# Altium schematic sheet 60_ETHERNET.SchDoc
size 297 x 209 mm
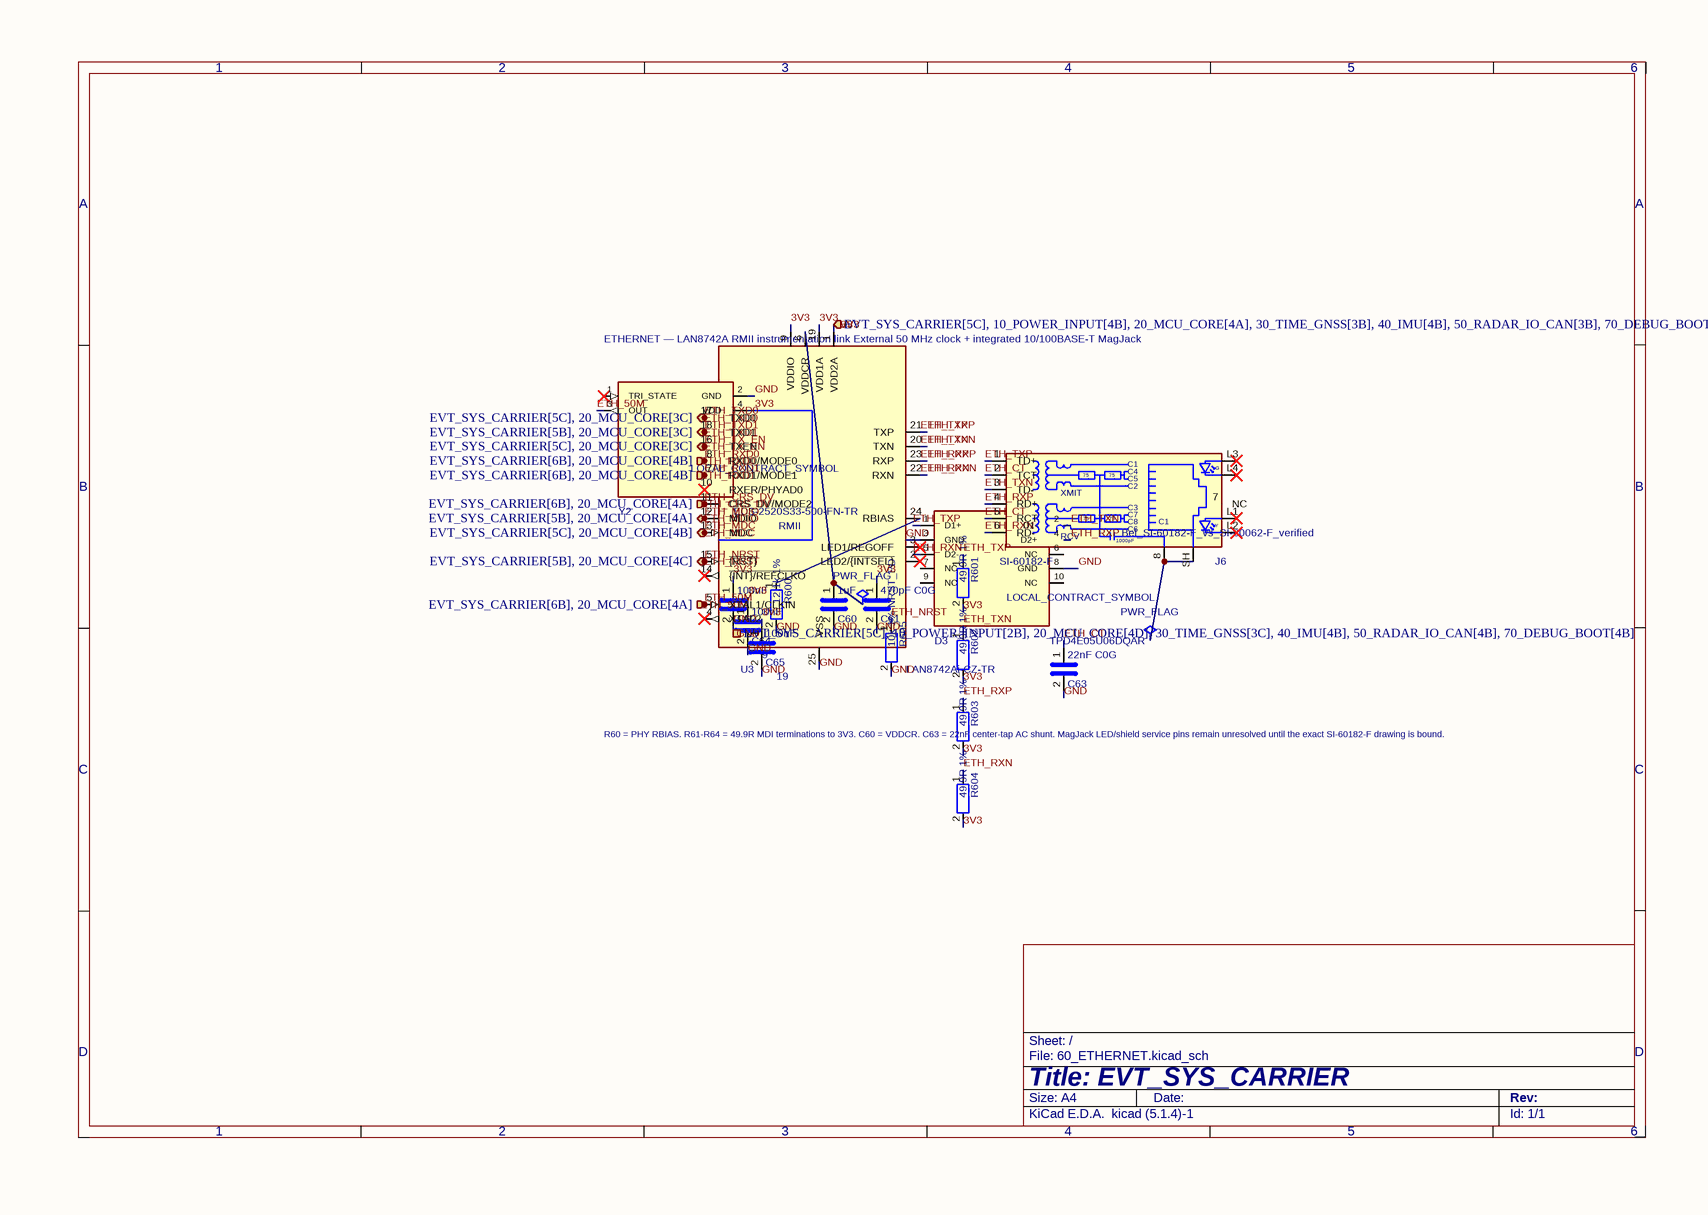
[diagram p0: 60_ETHERNET.SchDoc]

## Parts
#FLG0601  PWR_FLAG  (graphical)
#FLG0602  PWR_FLAG  (graphical)
C60  1uF  [C_0603_1608Metric]
C61  470pF C0G  [C_0402_1005Metric]
C62  Decouples_U3_Pin: 1  [C_0402_1005Metric]  (hidden comment: 100nF)
C63  22nF C0G  [C_0603_1608Metric]
C64  Decouples_U3_Pin: 9  [C_0402_1005Metric]  (hidden comment: 100nF)
C65  Decouples_U3_Pin: 19  [C_0402_1005Metric]  (hidden comment: 100nF)
D3  Capture_Status: LOCAL_CONTRACT_SYMBOL  [USON-10_2.5x1.0mm_P0.5mm]  (hidden comment: TPD4E05U06DQAR)
J6  Compatibility_Basis: Bel_SI-60182-F_vs_SI-60062-F_verified  [RJ45_Bel_SI-60062-F]  (hidden comment: SI-60182-F)
R600  12.1k 1%  [R_0603_1608Metric]
R601  49.9R 1%  [R_0402_1005Metric]
R602  49.9R 1%  [R_0402_1005Metric]
R603  49.9R 1%  [R_0402_1005Metric]
R604  49.9R 1%  [R_0402_1005Metric]
R605  10k 1% NRST_PD  [R_0603_1608Metric]
U3  LAN8742Ai-CZ-TR  [QFN-24-1EP_4x4mm_P0.5mm_EP2.6x2.6mm]
Y2  Capture_Status: LOCAL_CONTRACT_SYMBOL  [Oscillator_SMD_ECS_2520MV-xxx-xx-4Pin_2.5x2.0mm]  (hidden comment: ECS-2520S33-500-FN-TR)

## Ports
3V3 (in, see EVT_SYS_CARRIER[5C], 10_POWER_INPUT[4B], 20_MCU_CORE[4A], 30_TIME_GNSS[3B], 40_IMU[4B], 50_RADAR_IO_CAN[3B], 70_DEBUG_BOOT[3C]), ETH_50M (out, see EVT_SYS_CARRIER[6B], 20_MCU_CORE[4A]), ETH_CRS_DV (out, see EVT_SYS_CARRIER[6B], 20_MCU_CORE[4A]), ETH_MDC (in, see EVT_SYS_CARRIER[5C], 20_MCU_CORE[4B]), ETH_MDIO (bidir, see EVT_SYS_CARRIER[5B], 20_MCU_CORE[4A]), ETH_NRST (in, see EVT_SYS_CARRIER[5B], 20_MCU_CORE[4C]), ETH_RXD0 (out, see EVT_SYS_CARRIER[6B], 20_MCU_CORE[4B]), ETH_RXD1 (out, see EVT_SYS_CARRIER[6B], 20_MCU_CORE[4B]), ETH_TX_EN (in, see EVT_SYS_CARRIER[5C], 20_MCU_CORE[3C]), ETH_TXD0 (in, see EVT_SYS_CARRIER[5C], 20_MCU_CORE[3C]), ETH_TXD1 (in, see EVT_SYS_CARRIER[5B], 20_MCU_CORE[3C]), GND (see EVT_SYS_CARRIER[5C], 10_POWER_INPUT[2B], 20_MCU_CORE[4D], 30_TIME_GNSS[3C], 40_IMU[4B], 50_RADAR_IO_CAN[4B], 70_DEBUG_BOOT[4B])

## Nets
3V3: C61.1 C62.1 C64.1 C65.1 R601.2 R602.2 R603.2 R604.2 U3.1(VDD2A) U3.9(VDDIO) U3.19(VDD1A) Y2.4(VDD) ; port 3V3
ETH_50M: U3.5(XTAL1/CLKIN) Y2.3(OUT) ; port ETH_50M
ETH_CRS_DV: U3.11(CRS_DV/MODE2) ; port ETH_CRS_DV
ETH_CT: C63.1 J6.2(TCT) J6.5(RCT)
ETH_MDC: U3.13(MDC) ; port ETH_MDC
ETH_MDIO: U3.12(MDIO) ; port ETH_MDIO
ETH_NRST: R605.1 U3.15(~{{RST}}) ; port ETH_NRST
ETH_RXD0: U3.8(RXD0/MODE0) ; port ETH_RXD0
ETH_RXD1: U3.7(RXD1/MODE1) ; port ETH_RXD1
ETH_RXN: D3.5(D2-) J6.6(RD-) R604.1 U3.22(RXN)
ETH_RXP: D3.4(D2+) J6.4(RD+) R603.1 U3.23(RXP)
ETH_TX_EN: U3.16(TXEN) ; port ETH_TX_EN
ETH_TXD0: U3.17(TXD0) ; port ETH_TXD0
ETH_TXD1: U3.18(TXD1) ; port ETH_TXD1
ETH_TXN: D3.2(D1-) J6.3(TD-) R602.1 U3.20(TXN)
ETH_TXP: D3.1(D1+) J6.1(TD+) R601.1 U3.21(TXP)
GND: C60.2 C61.2 C62.2 C63.2 C64.2 C65.2 D3.3(GND) D3.8(GND) R600.2 R605.2 U3.25(VSS) Y2.2(GND) ; port GND
Net#FLG0601_1: #FLG0601.1 C60.1 U3.6(VDDCR)
Net#FLG0602_1: #FLG0602.1 J6.8 J6.SH
NetR600_1: R600.1 U3.24(RBIAS)

Not connected (* = marked no-connect by the designer): D3 6(NC) 7(NC) 9(NC) 10(NC); J6 7(NC) L1* L2* L3* L4*; U3 2(LED2/~{{INTSEL}})* 3(LED1/REGOFF)* 4(XTAL2)* 10(RXER/PHYAD0)* 14(~{{INT}/REFCLKO})*; Y2 1(TRI_STATE)*

## Notes on the sheet
- (near U3) ETHERNET — LAN8742A RMII instrumentation link
  External 50 MHz clock + integrated 10/100BASE-T MagJack
- (near R603) R60 = PHY RBIAS. R61-R64 = 49.9R MDI terminations to 3V3.
  C60 = VDDCR. C63 = 22nF center-tap AC shunt.
  MagJack LED/shield service pins remain unresolved until the exact SI-60182-F drawing is bound.
- 1
- 2
- 3
- 4
- 5
- 6
- A
- B
- C
- D
- Title: EVT_SYS_CARRIER
- File: 60_ETHERNET.kicad_sch
- Sheet: /
- KiCad E.D.A.  kicad (5.1.4)-1
- Size: A4
- Date:
- Rev:
- Id: 1/1
- (in symbol LAN8742A) RMII
- (in symbol RJ45_Bel_SI-60062-F) C1; G; 75; C4; C5; XMIT; C2; C3; C8; C7; Y; RCV; C6; 1000pF

## Library data of the parts
#FLG0601 #FLG0602 = PWR_FLAG: hierarchy_path: /2c46a14d-5e3e-43a9-b150-1ff871d46d46/032d0543-40e8-4b74-93ad-22729bd46394; Value: PWR_FLAG
C60 = C: MPN: 1uF_6.3V_X7R; hierarchy_path: /2c46a14d-5e3e-43a9-b150-1ff871d46d46/032d0543-40e8-4b74-93ad-22729bd46394; Value: 1uF; Footprint: Capacitor_SMD:C_0603_1608Metric
C61 = C: MPN: 470pF_C0G; hierarchy_path: /2c46a14d-5e3e-43a9-b150-1ff871d46d46/032d0543-40e8-4b74-93ad-22729bd46394; Value: 470pF C0G; Footprint: Capacitor_SMD:C_0402_1005Metric
C62 C64 C65 = C: MPN: 100nF_6.3V_X7R; hierarchy_path: /2c46a14d-5e3e-43a9-b150-1ff871d46d46/032d0543-40e8-4b74-93ad-22729bd46394; Value: 100nF; Footprint: Capacitor_SMD:C_0402_1005Metric
C63 = C: MPN: 22nF_C0G; hierarchy_path: /2c46a14d-5e3e-43a9-b150-1ff871d46d46/032d0543-40e8-4b74-93ad-22729bd46394; Value: 22nF C0G; Footprint: Capacitor_SMD:C_0603_1608Metric
D3 = TPD4E05U06DQAR: hierarchy_path: /2c46a14d-5e3e-43a9-b150-1ff871d46d46/032d0543-40e8-4b74-93ad-22729bd46394; MPN: TPD4E05U06DQAR; Value: TPD4E05U06DQAR; Footprint: Package_SON:USON-10_2.5x1.0mm_P0.5mm
J6 = RJ45_Bel_SI-60062-F: hierarchy_path: /2c46a14d-5e3e-43a9-b150-1ff871d46d46/032d0543-40e8-4b74-93ad-22729bd46394; MPN: SI-60182-F; Value: SI-60182-F; Footprint: Connector_RJ:RJ45_Bel_SI-60062-F
R600 = R: MPN: 12.1k_1%; hierarchy_path: /2c46a14d-5e3e-43a9-b150-1ff871d46d46/032d0543-40e8-4b74-93ad-22729bd46394; Value: 12.1k 1%; Footprint: Resistor_SMD:R_0603_1608Metric
R601-R604 = R: MPN: 49.9R_1%; hierarchy_path: /2c46a14d-5e3e-43a9-b150-1ff871d46d46/032d0543-40e8-4b74-93ad-22729bd46394; Value: 49.9R 1%; Footprint: Resistor_SMD:R_0402_1005Metric
R605 = R: MPN: 10k_1%; hierarchy_path: /2c46a14d-5e3e-43a9-b150-1ff871d46d46/032d0543-40e8-4b74-93ad-22729bd46394; Value: 10k 1% NRST_PD; Footprint: Resistor_SMD:R_0603_1608Metric
U3 = LAN8742A: hierarchy_path: /2c46a14d-5e3e-43a9-b150-1ff871d46d46/032d0543-40e8-4b74-93ad-22729bd46394; MPN: LAN8742Ai-CZ-TR; Value: LAN8742Ai-CZ-TR; Footprint: Package_DFN_QFN:QFN-24-1EP_4x4mm_P0.5mm_EP2.6x2.6mm
Y2 = ECS-2520S33-500-FN-TR: hierarchy_path: /2c46a14d-5e3e-43a9-b150-1ff871d46d46/032d0543-40e8-4b74-93ad-22729bd46394; MPN: ECS-2520S33-500-FN-TR; Value: ECS-2520S33-500-FN-TR; Footprint: Oscillator:Oscillator_SMD_ECS_2520MV-xxx-xx-4Pin_2.5x2.0mm